# Altium schematic sheet 03-ICs.SchDoc: ICs
size A; Revision: A; SheetNumber: 3; SheetTotal: 3; ECE315_Project_Name: ECE453 F24
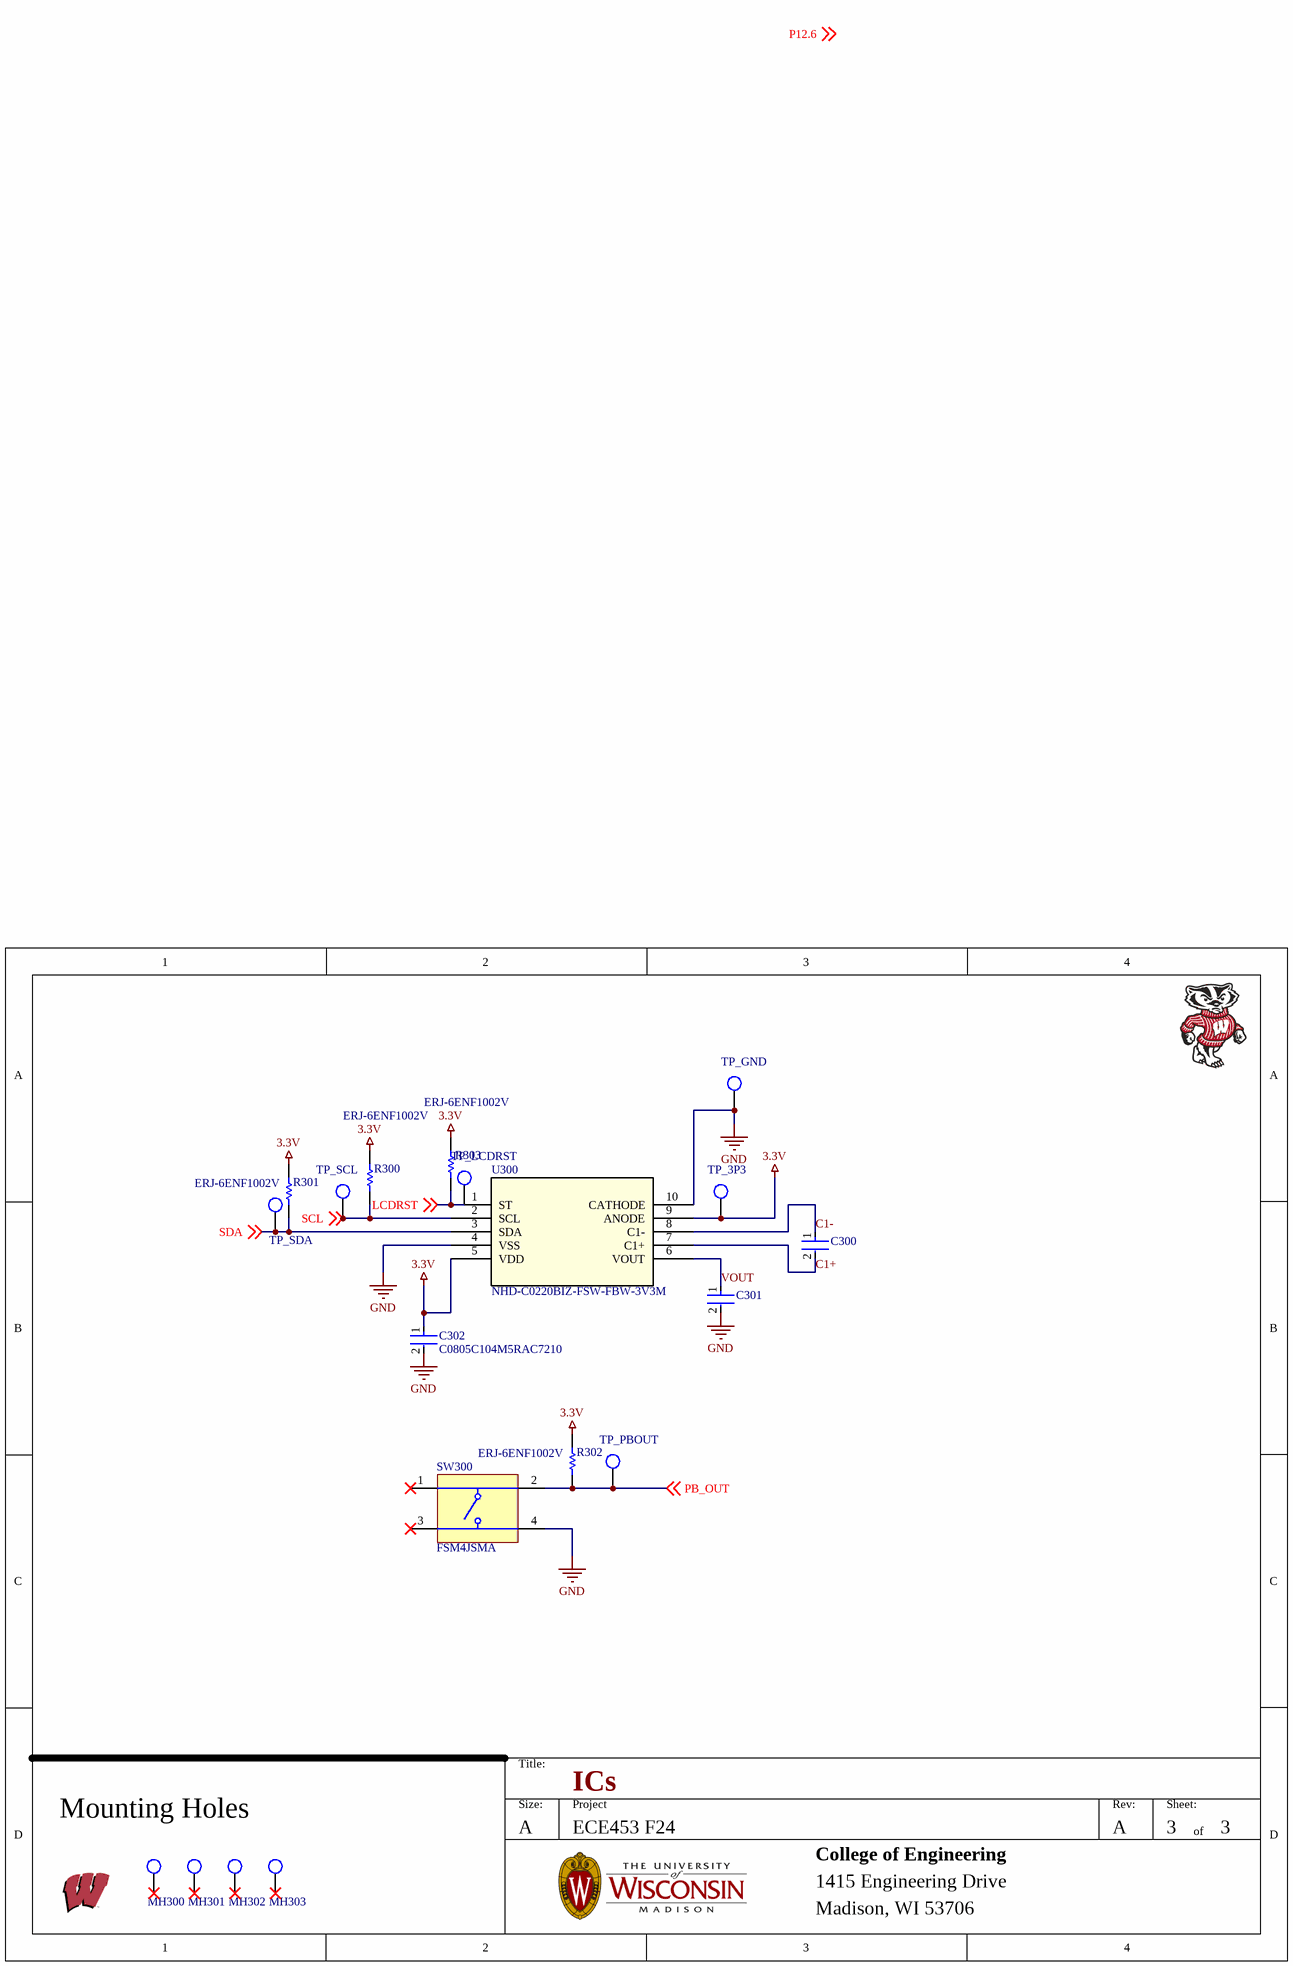
[diagram p0: 03-ICs.SchDoc]

## Parts
C300  C0805C104M5RAC7210  [FP-C0805C-DN-MFG]  (value not drawn)
C301  C0805C104M5RAC7210  [FP-C0805C-DN-MFG]  (value not drawn)
C302  C0805C104M5RAC7210  [FP-C0805C-DN-MFG]
MH300  MHOLE_2_95MM  [MHOLE_2_95MM]  (value not drawn)
MH301  MHOLE_2_95MM  [MHOLE_2_95MM]  (value not drawn)
MH302  MHOLE_2_95MM  [MHOLE_2_95MM]  (value not drawn)
MH303  MHOLE_2_95MM  [MHOLE_2_95MM]  (value not drawn)
R300  ERJ-6ENF1002V  [RESC2013X70X40ML20T20]
R301  ERJ-6ENF1002V  [RESC2013X70X40ML20T20]
R302  ERJ-6ENF1002V  [RESC2013X70X40ML20T20]
R303  ERJ-6ENF1002V  [RESC2013X70X40ML20T20]
SW300  FSM4JSMA  [TECO-FSM4JSMA_V]
TP_3P3  TP_5019  [FP-5019-MFG]  (value not drawn)
TP_GND  TP_5019  [FP-5019-MFG]  (value not drawn)
TP_LCDRST  TP_5019  [FP-5019-MFG]  (value not drawn)
TP_PBOUT  TP_5019  [FP-5019-MFG]  (value not drawn)
TP_SCL  TP_5019  [FP-5019-MFG]  (value not drawn)
TP_SDA  TP_5019  [FP-5019-MFG]  (value not drawn)
U300  NHD-C0220BIZ-FSW-FBW-3V3M  [NHD-C0220BIZ-FSW-FBW-3V3M_NDI]

## Nets
3.3V: C302.1 R300.2 R301.2 R302.2 R303.2 TP_3P3.1 U300.5(VDD) U300.9(ANODE)
GND: C301.2 C302.2 SW300.4 TP_GND.1 U300.4(VSS) U300.10(CATHODE)
C1+: C300.2 U300.7(C1+)
C1-: C300.1 U300.8(C1-)
LCDRST: R303.1 TP_LCDRST.1 U300.1(ST) ; off-sheet LCDRST
PB_OUT: R302.1 SW300.2 TP_PBOUT.1 ; off-sheet PB_OUT
SCL: R300.1 TP_SCL.1 U300.2(SCL) ; off-sheet SCL
SDA: R301.1 TP_SDA.1 U300.3(SDA) ; off-sheet SDA
VOUT: C301.1 U300.6(VOUT)

Not connected (* = marked no-connect by the designer): MH300 1*; MH301 1*; MH302 1*; MH303 1*; SW300 1* 3*

## Notes on the sheet
- Mounting Holes
- Labels drawn without touching a wire or pin: P12.6
- Title:
- Size:
- A
- Project
- Rev:
- Sheet:
- of
- College of Engineering
- 1415 Engineering Drive
- Madison, WI 53706

## Library data of the parts
C300 C301 = CMP-03020-012155-1: 1uF; Manufacturer: KEMET; Tolerance: 0.2; Capacitance: 0.10 μF; Material: Ceramic; Temperature Characteristic: X7R; Voltage Rating: 50 V; Temperature Coefficient: 30ppm/°C; Value: 0.10 μF; Manufacturer Part Number: C0805C104M5RAC7210; Octopart: https://octopart.com/c0805c104m5rac7210-kemet-3909515; Ipc Land Pattern Name: CAPC200125X78; Automotive: No; Device Class L1: Passive Components; Height: 0.88mm; Category: Cap; Temperature Range Low: -55°C; Package: C0805C-DN; Device Class L3: Ceramic Capacitors; Temperature: -55°C to +125°C; RoHS: TRUE; Temperature Range High: +125°C; ComponentLink2Description: Datasheet; Lead Free: Yes; ComponentLink2URL: https://content.kemet.com/datasheets/KEM_C1003_C0G_SMD.pdf; Device Class L2: Capacitors
C302 = CMP-03020-012155-1: C0805 0.10 μF X7R 30ppm/°C 20.00% 50 V; Manufacturer: KEMET; Tolerance: 0.2; Capacitance: 0.10 μF; Material: Ceramic; Voltage Rating: 50 V; Value: 0.10 μF; Manufacturer Part Number: C0805C104M5RAC7210; Octopart: https://octopart.com/c0805c104m5rac7210-kemet-3909515; Ipc Land Pattern Name: CAPC200125X78; Automotive: No; Device Class L1: Passive Components; Height: 0.88mm; Category: Cap; Temperature Range Low: -55°C; Temperature Characteristic: X7R; Package: C0805C-DN; Device Class L3: Ceramic Capacitors; Temperature: -55°C to +125°C; Temperature Coefficient: 30ppm/°C; RoHS: TRUE; Temperature Range High: +125°C; ComponentLink2Description: Datasheet; Lead Free: Yes; ComponentLink2URL: https://content.kemet.com/datasheets/KEM_C1003_C0G_SMD.pdf; Device Class L2: Capacitors
MH300-MH303 = MHOLE_2_95MM: Mounting Holde; Manufacturer Part Number: UW MTHOLE
R300-R303 = CMP-2001-04376-1: Manufacturer: Panasonic; Part Number: ERJ-6ENF1002V
SW300 = CMP-2000-05602-2: Swicth, SPST, 24 V, -35 to 85 degC, 4-Pin SMD, RoHS, Tape and Reel; Manufacturer: TE Connectivity; Switch Travel: 0.25mm; Mechanical Life: 100000Cycles; Contact Current Rating: 50mA; Operating Force: 1.57N; Actuator Material: Polyamide; Contact Resistance: 100mOhm; Voltage Rating: 24V; Illumination Type: Illuminated; Actuator Length: 0.055inch; Max Voltage Rating (DC): 12V; Case\/Package: SMD/SMT; Orientation: Straight; Datasheet URL: http://www.te.com/commerce/DocumentDelivery/DDEController?Action=showdoc&DocId=Customer+Drawing%7F2-1437565-7%7FV%7Fpdf%7FEnglish%7FENG_CD_2-1437565-7_V.pdf%7F4-1437565-2; Min Operating Temperature: -35degC; Packaging: LoosePiece; Termination: GullWing; Throw Configuration: SPST; Package Description: 4-Pin Surface Mount Device, Body 6 x 6 mm, Pitch 4.5 mm; Mounting Technology: SurfaceMount; Contact Plating: Silver; Datasheet Version: Rev. V, 02/2015; RoHSCompliant: true; Max Operating Temperature: 85degC; Length: 6mm; Voltage Rating (DC): 24V; Electrical Life: 100000Cycles; Current Rating: 50mA; Package Quantity: 750; Mount: SurfaceMount; Package Reference: FSM4JSMA; Manufacturer URL: http://www.te.com/; Width: 6mm; REACH SVHC: Unknown; Contact Material: CopperAlloy
TP_3P3 TP_GND TP_LCDRST TP_PBOUT TP_SCL TP_SDA = TP_5019: Test Point, Mini, SMT, Phos Bronze/Silver, 1000pc Tape & Reel | Keystone Electronics 5019; Manufacturer Part Number: 5019; Plating: Silver; Body Material: Bronze; Number of Contacts: 1NUMBER; Supplier 1: Digikey; Supplier Part Number 1: 36-5019CT-ND; Manufacturer: Keystone Electronics; RoHS: Yes; Category: Terminals; Stock: 282853; Pricing: 1=0.37, 25=0.2496, 100=0.2117, 250=0.1902, 500=0.1756, 1000=0.16229, 2000=0.15019, 3000=0.14362, 5000=0.13585, 7000=0.13102, 10000=0.12613, 25000=0.1211 (USD); Mounting Technology: Surface Mount,PCB; Pins: 1; Contact Plating: Silver; Contact Material: Bronze; Material: Bronze; Packaging: Tape and Reel; Package Quantity: 1; Termination: SMD/SMT; Series: 5019; Height: 0.09inch; Reach SVHC Compliant: No; RoHS Compliant: Yes; Lead Free: Lead Free; ComponentLink1URL: https://datasheet.ciiva.com/14848/m60-2p61-14848437.pdf?src-supplier=Digikey; ComponentLink1Description: https://datasheet.ciiva.com/14848/m60-2p61-14848437.pdf?src-supplier=Digikey; ComponentLink2URL: https://datasheet.ciiva.com/14848/m60-2p61-14848438.pdf?src-supplier=Digikey; ComponentLink2Description: https://datasheet.ciiva.com/14848/m60-2p61-14848438.pdf?src-supplier=Digikey; ComponentLink3URL: https://datasheet.ciiva.com/14848/m60-2p61-14848439.pdf?src-supplier=Digikey; ComponentLink3Description: https://datasheet.ciiva.com/14848/m60-2p61-14848439.pdf?src-supplier=Digikey; ComponentLink4URL: https://datasheet.ciiva.com/16885/70182998-16885945.pdf?src-supplier=Allied+Electronics; ComponentLink4Description: https://datasheet.ciiva.com/16885/70182998-16885945.pdf?src-supplier=Allied+Electronics; ComponentLink5URL: https://datasheet.ciiva.com/16318/m60-2p61-16318395.pdf?src-supplier=Future+Electronics; ComponentLink5Description: https://datasheet.ciiva.com/16318/m60-2p61-16318395.pdf?src-supplier=Future+Electronics
U300 = NHD-C0220BIZ-FSW-FBW-3V3M: LCD COG CHAR 2X20 WH TRANSFL; Mfr_Name: Newhaven Display International; Manufacturer: Newhaven Display; Backlight Type: LED; Interface: I2C; Operating Supply Voltage: 3.3V; Contrast Ratio: 6:1; Number of Characters: 40; Background Color: White; Fluid Type: FSTN POSITIVE; RefDes: RefDes; Type: Type; Supplier: Digikey; Supplier Part Number: NHD-C0220BIZ-FSW-FBW-3V3M-ND; Manufacturer Part Number: NHD-C0220BIZ-FSW-FBW-3V3M; RoHS: Yes; Stock: 13689; Pricing: 1=11.41, 5=10.726, 10=10.041, 50=9.4704, 100=9.2394 (USD); Mounting Technology: Through Hole; Pins: 8; Min Operating Temperature: -20°C; Max Operating Temperature: 70°C; Packaging: Bulk; Series: -; RoHS Compliant: Yes; ComponentLink1URL: https://datasheet.ciiva.com/2102/nhd-c0220biz-fsw-fbw-3v3m-2102241.pdf?src-supplier=Digikey; ComponentLink1Description: https://datasheet.ciiva.com/2102/nhd-c0220biz-fsw-fbw-3v3m-2102241.pdf?src-supplier=Digikey; ComponentLink2URL: https://datasheet.ciiva.com/5326/nhd-c0220biz-fsw-fbw-3v3m-31762-5326184.pdf?src-supplier=Mouser; ComponentLink2Description: https://datasheet.ciiva.com/5326/nhd-c0220biz-fsw-fbw-3v3m-31762-5326184.pdf?src-supplier=Mouser; ComponentLink3URL: https://datasheet.ciiva.com/30148/nhd-c0220biz-fsw-fbw-3v3m-30148736.pdf?src-supplier=Onlinecomponents.com; ComponentLink3Description: https://datasheet.ciiva.com/30148/nhd-c0220biz-fsw-fbw-3v3m-30148736.pdf?src-supplier=Onlinecomponents.com; ComponentLink4URL: https://datasheet.ciiva.com/19478/2189011-19478701.pdf?src-supplier=Jameco; ComponentLink4Description: https://datasheet.ciiva.com/19478/2189011-19478701.pdf?src-supplier=Jameco